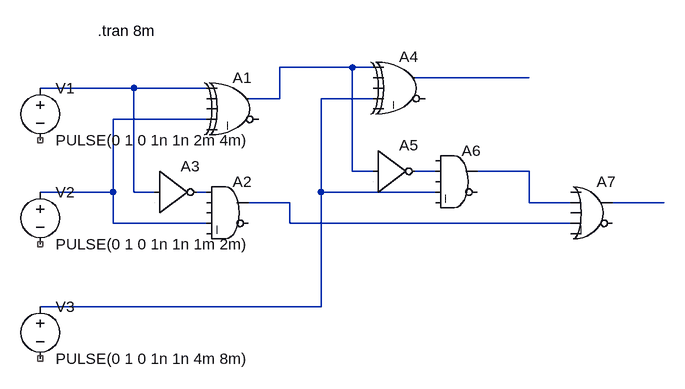
[diagram p0: schematic FS.asc]
FS.asc, the LTspice schematic file:
Version 4.1
SHEET 1 1044 680
WIRE 560 16 448 16
WIRE 592 16 560 16
WIRE 832 32 656 32
WIRE 224 48 80 48
WIRE 336 48 224 48
WIRE 448 64 448 16
WIRE 448 64 400 64
WIRE 592 64 512 64
WIRE 336 96 192 96
WIRE 560 176 560 16
WIRE 592 176 560 176
WIRE 688 176 656 176
WIRE 832 176 752 176
WIRE 192 208 192 96
WIRE 192 208 80 208
WIRE 224 208 224 48
WIRE 256 208 224 208
WIRE 336 208 320 208
WIRE 512 208 512 64
WIRE 688 208 512 208
WIRE 464 224 400 224
WIRE 832 224 832 176
WIRE 896 224 832 224
WIRE 1040 224 960 224
WIRE 192 256 192 208
WIRE 336 256 192 256
WIRE 464 256 464 224
WIRE 896 256 464 256
WIRE 512 384 512 208
WIRE 512 384 80 384
SYMBOL voltage 80 32 R0
WINDOW 123 0 0 Left 0
WINDOW 39 0 0 Left 0
SYMATTR InstName V1
SYMATTR Value PULSE(0 1 0 1n 1n 2m 4m)
SYMBOL voltage 80 192 R0
WINDOW 123 0 0 Left 0
WINDOW 39 0 0 Left 0
SYMATTR InstName V2
SYMATTR Value PULSE(0 1 0 1n 1n 1m 2m)
SYMBOL Digital\\xor 384 16 R0
SYMATTR InstName A1
SYMBOL Digital\\and 368 176 R0
SYMATTR InstName A2
SYMBOL Digital\\inv 256 144 R0
SYMATTR InstName A3
SYMBOL Digital\\xor 640 -16 R0
SYMATTR InstName A4
SYMBOL Digital\\inv 592 112 R0
SYMATTR InstName A5
SYMBOL Digital\\and 720 128 R0
SYMATTR InstName A6
SYMBOL Digital\\or 928 176 R0
SYMATTR InstName A7
SYMBOL voltage 80 368 R0
WINDOW 123 0 0 Left 0
WINDOW 39 0 0 Left 0
SYMATTR InstName V3
SYMATTR Value PULSE(0 1 0 1n 1n 4m 8m)
TEXT 168 -40 Left 2 !.tran 8m

The netlist it stands for:
* FS.asc
V1 N003 NC_01 PULSE(0 1 0 1n 1n 2m 4m)
V2 N005 NC_02 PULSE(0 1 0 1n 1n 1m 2m)
A1 N003 0 0 N005 0 0 N001 0 XOR
A2 N008 0 0 N005 0 0 N009 0 AND
A3 N003 0 0 0 0 N008 0 0 BUF
A4 N001 0 0 N004 0 0 N002 0 XOR
A5 N001 0 0 0 0 N006 0 0 BUF
A6 0 N006 0 N004 0 0 N007 0 AND
A7 0 N007 0 N009 0 0 N010 0 OR
V3 N004 NC_03 PULSE(0 1 0 1n 1n 4m 8m)
.tran 8m
.backanno
.end